# Altium schematic sheet NeoLink Basic Main Board - Top Level.SchDoc: Top Level
size A3; DocumentNumber: 1; SheetNumber: 1; SheetTotal: 9
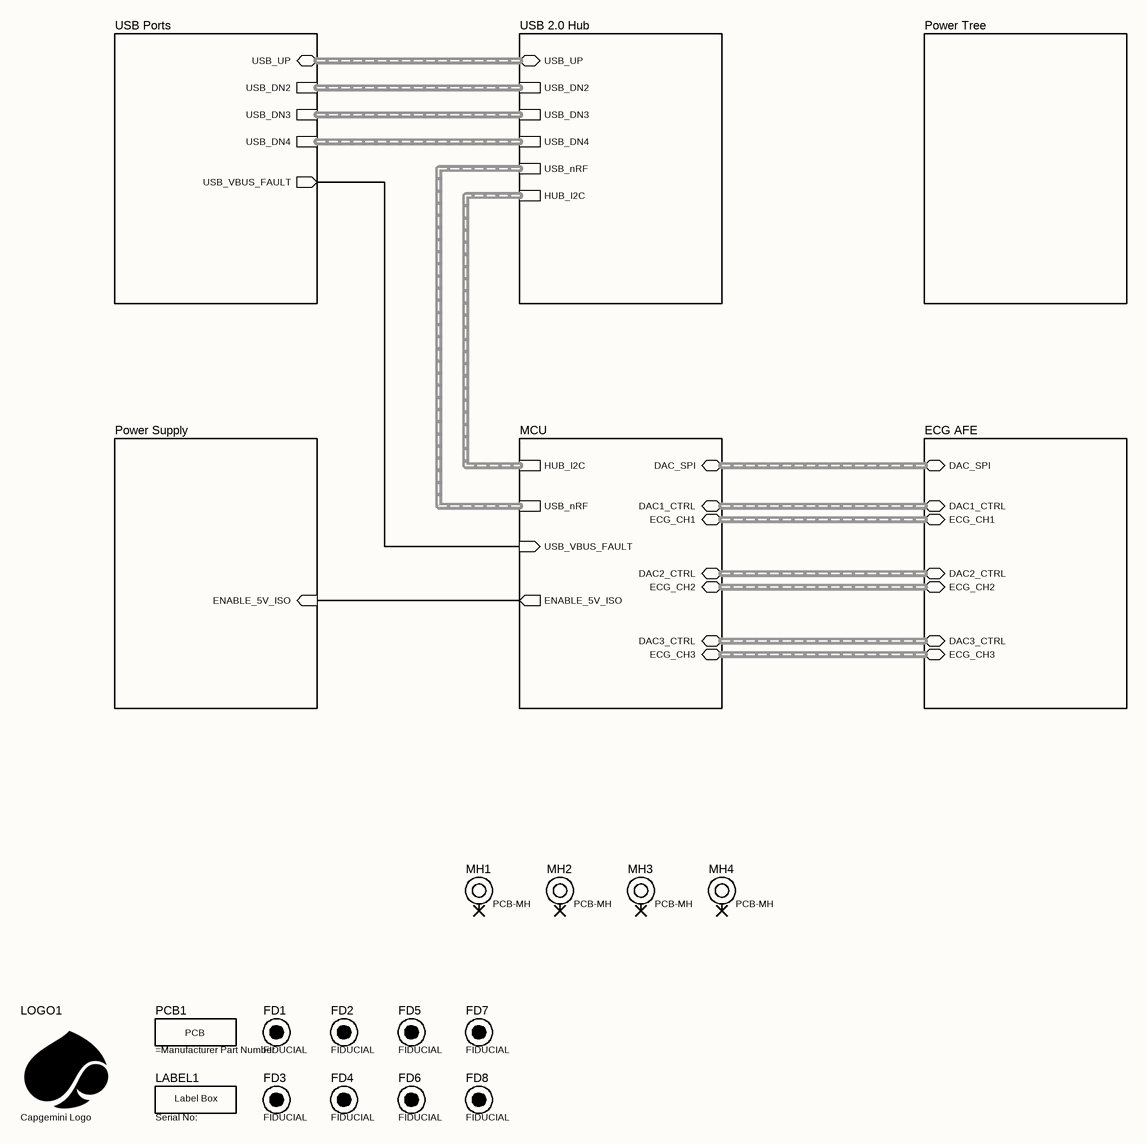
[diagram p0: NeoLink Basic Main Board - Top Level.SchDoc]

## Parts
FD1  FIDUCIAL  [FIDUCIAL-1MM]  (no BOM)
FD2  FIDUCIAL  [FIDUCIAL-1MM]  (no BOM)
FD3  FIDUCIAL  [FIDUCIAL-1MM]  (no BOM)
FD4  FIDUCIAL  [FIDUCIAL-1MM]  (no BOM)
FD5  FIDUCIAL  [FIDUCIAL-1MM]  (no BOM)
FD6  FIDUCIAL  [FIDUCIAL-1MM]  (no BOM)
FD7  FIDUCIAL  [FIDUCIAL-1MM]  (no BOM)
FD8  FIDUCIAL  [FIDUCIAL-1MM]  (no BOM)
LABEL1  Serial No:  [Label Box, Rectangle, 6mm x 20mm]  (no BOM)
LOGO1  Capgemini Logo  [Capgemini Copper Logo - Large]  (no BOM)
MH1  PCB-MH  [PCB-MH-M3-LF-PH]  (no BOM)
MH2  PCB-MH  [PCB-MH-M3-LF-PH]  (no BOM)
MH3  PCB-MH  [PCB-MH-M3-LF-PH]  (no BOM)
MH4  PCB-MH  [PCB-MH-M3-LF-PH]  (no BOM)
PCB1  (no value)  (mechanical)

## Sub-sheets
ECG AFE = ECG AFE.SchDoc: DAC_SPI (bidir, harness DAC_SPI), DAC1_CTRL (bidir, harness DAC_SPI), DAC2_CTRL (bidir, harness DAC_SPI), DAC3_CTRL (bidir, harness DAC_SPI), ECG_CH1 (bidir, harness ECG_CH1), ECG_CH2 (bidir, harness ECG_CH1), ECG_CH3 (bidir, harness ECG_CH1)
MCU = MCU.SchDoc: DAC_SPI (bidir, harness DAC_SPI), DAC1_CTRL (bidir, harness DAC_SPI), DAC2_CTRL (bidir, harness DAC_SPI), DAC3_CTRL (bidir, harness DAC_SPI), ECG_CH1 (bidir, harness ECG_CH1), ECG_CH2 (bidir, harness ECG_CH1), ECG_CH3 (bidir, harness ECG_CH1), USB_nRF (harness USB_nRF), HUB_I2C (harness HUB_I2C), USB_VBUS_FAULT (in), ENABLE_5V_ISO (out)
Power Supply = Power Supply.SchDoc: ENABLE_5V_ISO (in)
Power Tree = Power Tree.SchDoc: no entries
USB 2.0 Hub = USB 2.0 Hub.SchDoc: USB_DN2 (harness USB_DN2), USB_DN3 (harness USB_DN3), USB_DN4 (harness USB_DN4), USB_UP (bidir, harness USB_UP), USB_nRF (harness USB_nRF), HUB_I2C (harness HUB_I2C)
USB Ports = USB Ports.SchDoc: USB_DN2 (harness USB_DN2), USB_DN3 (harness USB_DN3), USB_DN4 (harness USB_DN4), USB_UP (bidir, harness USB_UP), USB_VBUS_FAULT (out)

## Nets
(unnamed): sheet Power Supply/ENABLE_5V_ISO, sheet MCU/ENABLE_5V_ISO
(unnamed): sheet USB Ports/USB_VBUS_FAULT, sheet MCU/USB_VBUS_FAULT

Not connected (* = marked no-connect by the designer): MH1 MH*; MH2 MH*; MH3 MH*; MH4 MH*

## Buses and harness runs
harness sheet ECG AFE/DAC1_CTRL = sheet MCU/DAC1_CTRL
harness sheet ECG AFE/DAC2_CTRL = sheet MCU/DAC2_CTRL
harness sheet ECG AFE/DAC3_CTRL = sheet MCU/DAC3_CTRL
harness sheet ECG AFE/DAC_SPI = sheet MCU/DAC_SPI
harness sheet ECG AFE/ECG_CH1 = sheet MCU/ECG_CH1
harness sheet ECG AFE/ECG_CH2 = sheet MCU/ECG_CH2
harness sheet ECG AFE/ECG_CH3 = sheet MCU/ECG_CH3
harness sheet MCU/HUB_I2C = sheet USB 2.0 Hub/HUB_I2C
harness sheet MCU/USB_nRF = sheet USB 2.0 Hub/USB_nRF
harness sheet USB 2.0 Hub/USB_DN2 = sheet USB Ports/USB_DN2
harness sheet USB 2.0 Hub/USB_DN3 = sheet USB Ports/USB_DN3
harness sheet USB 2.0 Hub/USB_DN4 = sheet USB Ports/USB_DN4
harness sheet USB 2.0 Hub/USB_UP = sheet USB Ports/USB_UP

## Notes on the sheet
- COMMERCIAL IN CONFIDENCE
- CLIENT
- THIS DOCUMENT IS UNCONTROLLED WHEN PRINTED
- PROJECT
- PART NAME
- TITLE
- SHEET SIZE
- SHEET
- DATE
- A3
- FILE
- PROJECT CODE
- PART / DWG No.
- REV
- VARIANT
- AUTHOR
- (in symbol CMP-0000003197-1) PCB

## Library data of the parts
FD1-FD8 = CMP-0000000671-3
LABEL1 = CMP-0000002854-5: Manufacturer: N/A; Manufacturer Part Number: N/A
LOGO1 = CMP-0000003196-9: Manufacturer: N/A; Manufacturer Part Number: N/A
MH1-MH4 = CMP-0000002988-3
PCB1 = CMP-0000003197-1: Capgemini PCB BOM Component; Manufacturer Part Number: =ProjectCode+'-'+PCBNo+'-'+PCBRev; Manufacturer: =ClientName